# Altium schematic sheet Sheet1.SchDoc (part 1 of 3)
size 420 x 297 mm; SheetNumber: 1; SheetTotal: 2
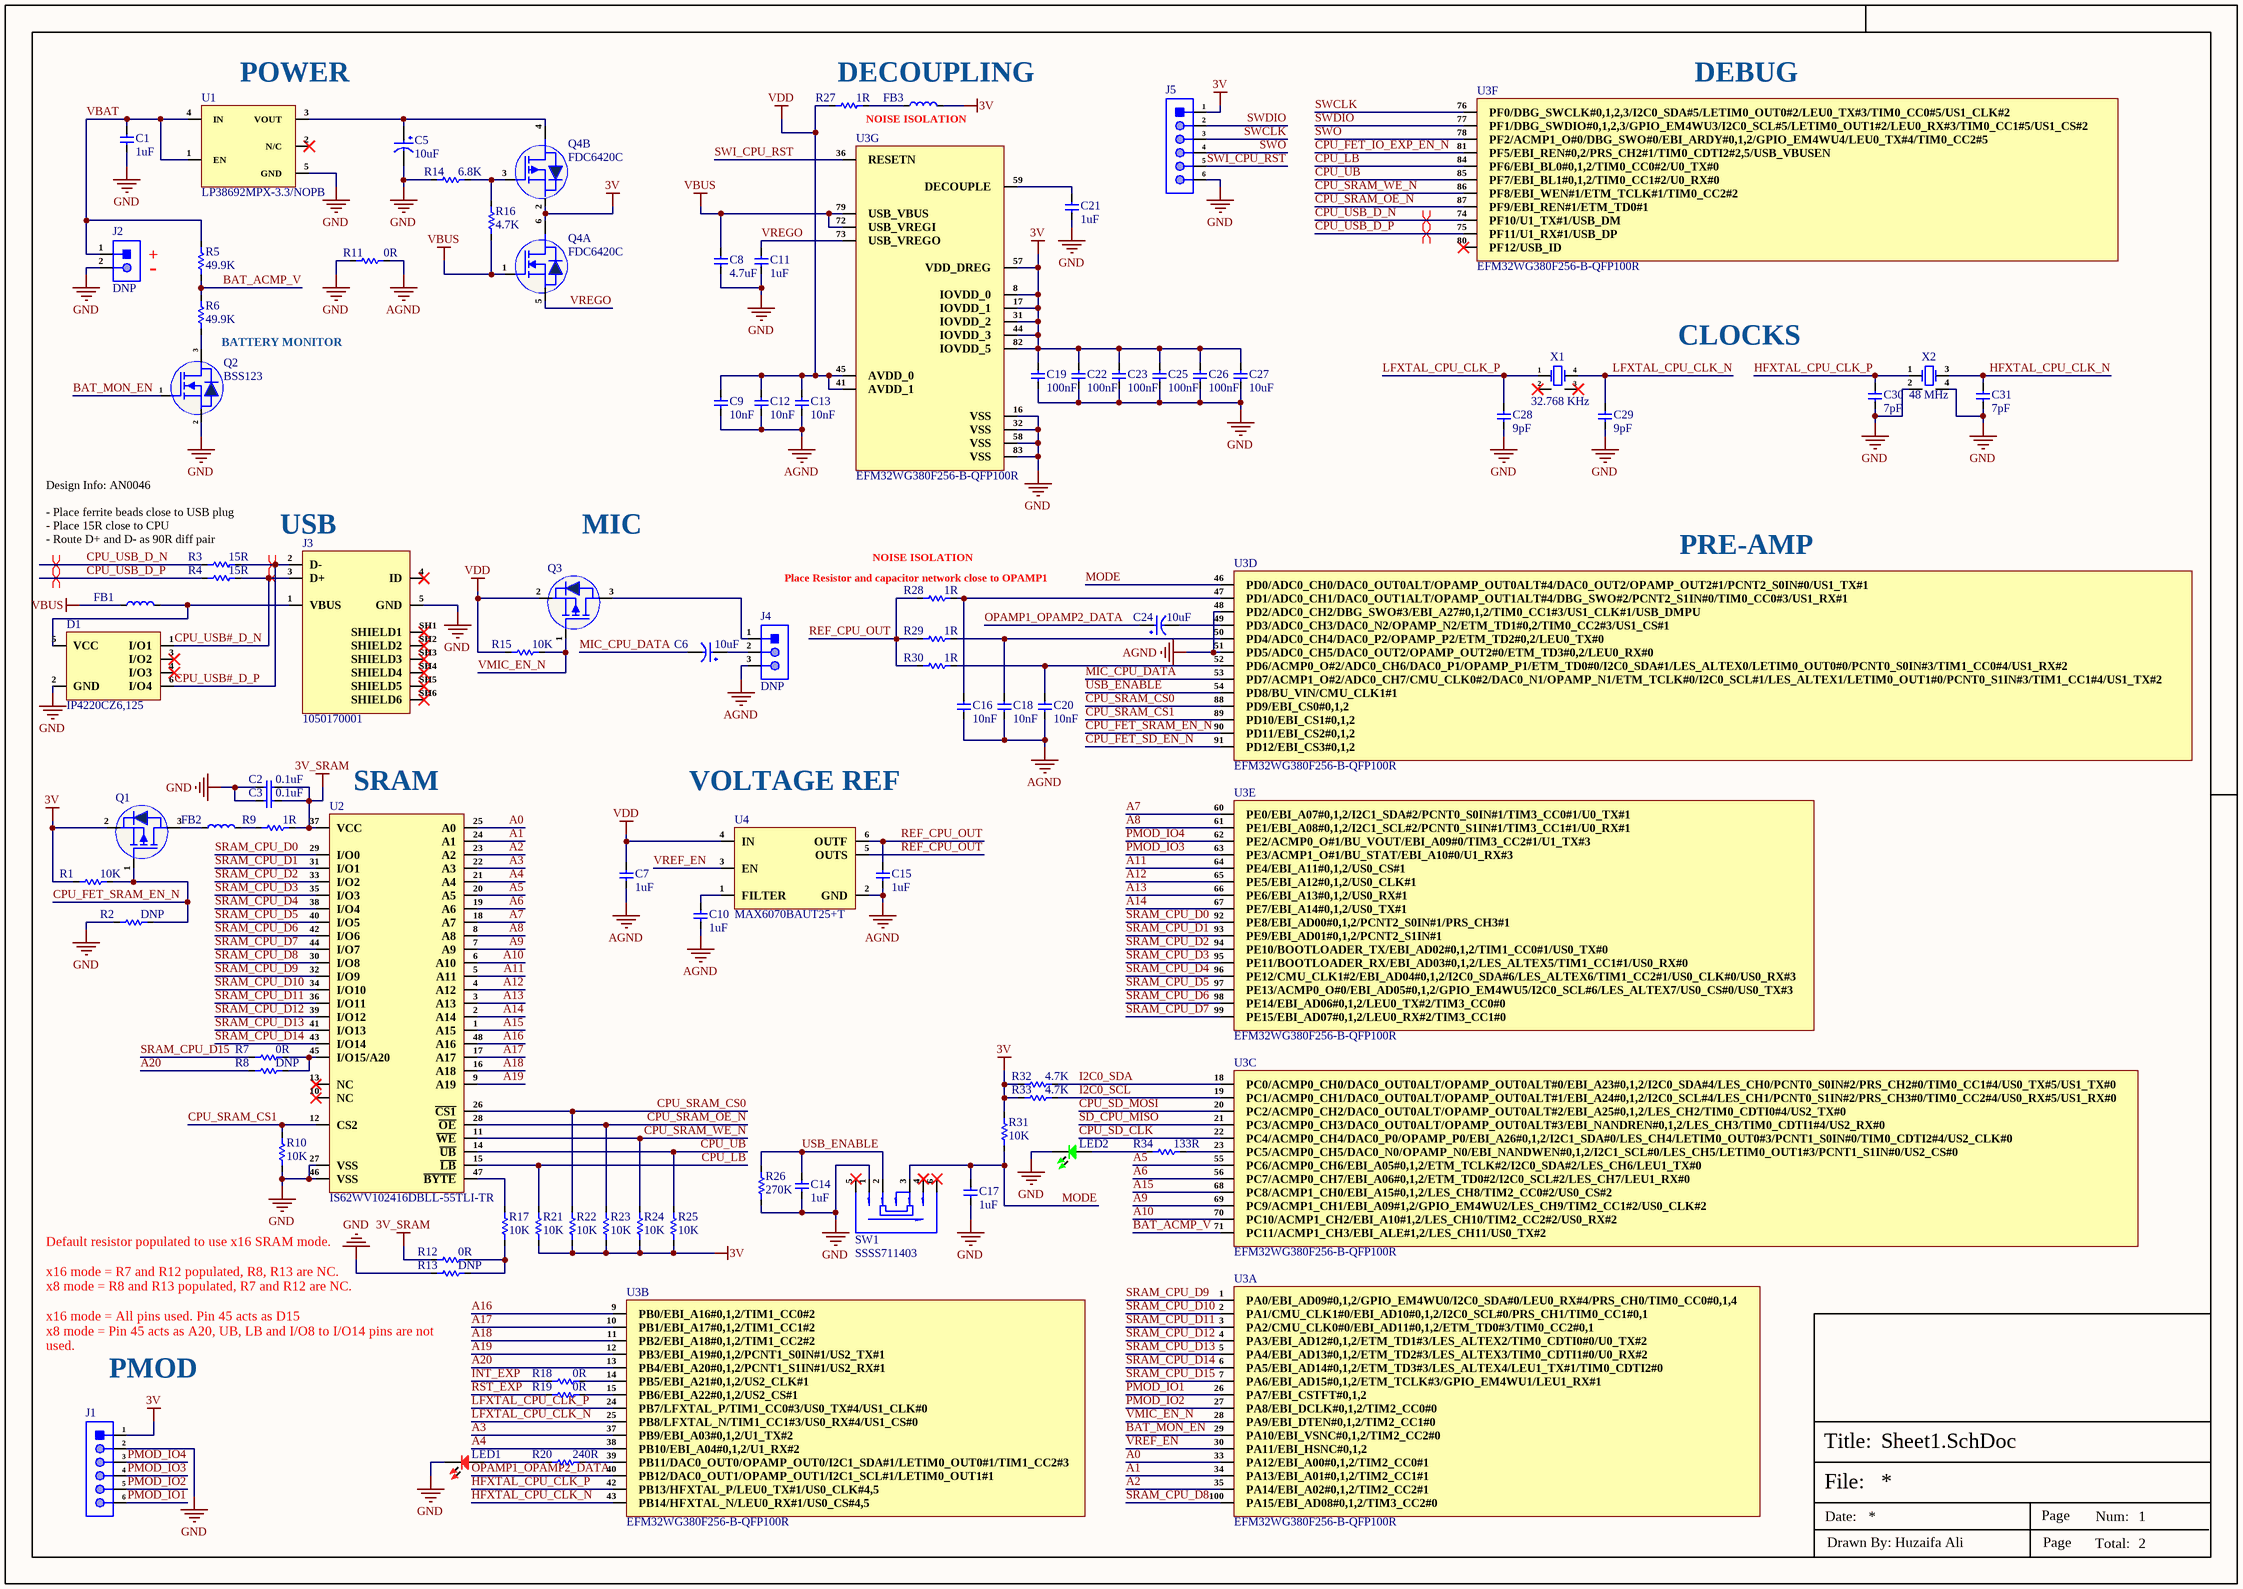
[diagram p0: Sheet1.SchDoc]

## Parts
C1  1uF  [Cap-0402]
C2  0.1uF  [Cap-0402]
C3  0.1uF  [Cap-0402]
C5  10uF  [Case-A]
C6  10uF  [Case-A]
C7  1uF  [Cap-0402]
C8  4.7uF  [Cap-0402]
C9  10nF  [Cap-0402]
C10  1uF  [Cap-0402]
C11  1uF  [Cap-0402]
C12  10nF  [Cap-0402]
C13  10nF  [Cap-0402]
C14  1uF  [Cap-0402]
C15  1uF  [Cap-0402]
C16  10nF  [Cap-0402]
C17  1uF  [Cap-0402]
C18  10nF  [Cap-0402]
C19  100nF  [cap-0402]
C20  10nF  [Cap-0402]
C21  1uF  [Cap-0402]
C22  100nF  [cap-0402]
C23  100nF  [cap-0402]
C24  10uF  [Case-A]
C25  100nF  [cap-0402]
C26  100nF  [cap-0402]
C27  10uF  [Cap-0603]
C28  9pF  [Cap-0402]
C29  9pF  [Cap-0402]
C30  7pF  [Cap-0402]
C31  7pF  [Cap-0402]
D1  IP4220CZ6,125  [6-TSOP]
FB1  BLM21PG221SN1D  [Ind-0805]  (value not drawn)
FB2  BLM18HG601SN1D  [IND-0603 (1608 Metric)]  (value not drawn)
FB3  CBW201209U102T  [Ind-0805]  (value not drawn)
J1  MA06-1SMD_BOARD_EDGE  [TSM-106-X-SH-BOARDEDGE]  (value not drawn)  (no BOM)
J2  DNP  [HDR1X2_]
J3  1050170001  [1050170001]
J4  DNP  [HDR1X3_]
J5  MA06-1SMD_BOARD_EDGE  [TSM-106-X-SH-BOARDEDGE]  (value not drawn)  (no BOM)
LED1  RED  [LED-0603]  (value not drawn)
LED2  Emerald  [LED-0603]  (value not drawn)
Q1  LBSS84WT1G  [SC-70]  (value not drawn)
Q2  BSS123  [SOT-23]
Q3  LBSS84WT1G  [SC-70]  (value not drawn)
Q4  FDC6420C  [SuperSOT-6]  (parts A,B of 2)
R1  10K  [Res-0402]
R2  DNP  [Res-0402]
R3  15R  [Res-0603]
R4  15R  [Res-0603]
R5  49.9K  [Res-0402]
R6  49.9K  [Res-0402]
R7  0R  [Res-0402]
R8  DNP  [Res-0402]
R9  1R  [Res-0402]
R10  10K  [Res-0402]
R11  0R  [Res-0603]
R12  0R  [Res-0402]
R13  DNP  [Res-0402]
R14  6.8K  [Res-0402]
R15  10K  [Res-0402]
R16  4.7K  [Res-0402]
R17  10K  [Res-0402]
R18  0R  [Res-0402]
R19  0R  [Res-0402]
R20  240R  [Res-0402]
R21  10K  [Res-0402]
R22  10K  [Res-0402]
R23  10K  [Res-0402]
R24  10K  [Res-0402]
R25  10K  [Res-0402]
R26  270K  [Res-0603]
R27  1R  [Res-0402]
R28  1R  [Res-0402]
R29  1R  [Res-0402]
R30  1R  [Res-0402]
R31  10K  [Res-0402]
R32  4.7K  [Res-0402]
R33  4.7K  [Res-0402]
R34  133R  [Res-0402]
SW1  SSSS711403  [SSSS711403]
U1  LP38692MPX-3.3/NOPB  [SOT-223-5]
U2  IS62WV102416DBLL-55TLI-TR  [48-TSOP I]
U3  EFM32WG380F256-B-QFP100R  [LQFP-100]  (parts A,B,C,D,E,F,G of 7)
U4  MAX6070BAUT25+T  [SOT-23-6]
X1  32.768 KHz  [MC-146_]
X2  48 MHz  [SMD2016-4P]

## Nets
3V: C19.2 C22.2 C23.2 C25.2 C26.2 C27.2 FB3.2 J1.1 J5.1 Q1.2(S) Q4.2(S2) Q4.6(D1) R1.1 R21.1 R22.1 R23.1 R24.1 R25.1 R31.2 R32.1 R33.1 U3.8(IOVDD_0) U3.17(IOVDD_1) U3.31(IOVDD_2) U3.44(IOVDD_3) U3.57(VDD_DREG) U3.82(IOVDD_5)
3V_SRAM: C2.1 C3.1 R9.1 R12.1 U2.37(VCC)
AGND: C7.1 C9.1 C10.1 C12.1 C13.1 C15.1 C16.1 C18.1 C20.1 J4.3 R11.2 U3.48(PD2/ADC0_CH2/DBG_SWO#3/EBI_A27#0,1,2/TIM0_CC1#3/US1_CLK#1/USB_DMPU) U3.51(PD5/ADC0_CH5/DAC0_OUT2/OPAMP_OUT2#0/ETM_TD3#0,2/LEU0_RX#0) U4.2(GND)
GND: C1.1 C2.2 C3.2 C5.2 C8.1 C11.1 C14.1 C17.1 C19.1 C21.1 C22.1 C23.1 C25.1 C26.1 C27.1 C28.1 C29.1 C30.1 C31.1 D1.2(GND) J1.2 J2.2 J3.5(GND) J5.6 LED1.2 LED2.2 Q2.2(S) R2.1 R10.1 R11.1 R13.1 R14.1 R26.1 SW1.1 U1.5(GND) U2.27(VSS) U2.46(VSS) U3.16(VSS) U3.32(VSS) U3.58(VSS) U3.83(VSS) X2.2(GND) X2.4(GND)
VBUS: C8.2 FB1.1 Q4.1(G1) R16.1 U3.72(USB_VREGI) U3.79(USB_VBUS)
VDD: C7.2 C9.2 C12.2 C13.2 Q3.2(S) R15.1 R27.2 U3.41(AVDD_1) U3.45(AVDD_0) U4.4(IN)
A0: U2.25(A0) U3.33(PA12/EBI_A00#0,1,2/TIM2_CC0#1)
A1: U2.24(A1) U3.34(PA13/EBI_A01#0,1,2/TIM2_CC1#1)
A2: U2.23(A2) U3.35(PA14/EBI_A02#0,1,2/TIM2_CC2#1)
A3: U2.22(A3) U3.37(PB9/EBI_A03#0,1,2/U1_TX#2)
A4: U2.21(A4) U3.38(PB10/EBI_A04#0,1,2/U1_RX#2)
A5: U2.20(A5) U3.55(PC6/ACMP0_CH6/EBI_A05#0,1,2/ETM_TCLK#2/I2C0_SDA#2/LES_CH6/LEU1_TX#0)
A6: U2.19(A6) U3.56(PC7/ACMP0_CH7/EBI_A06#0,1,2/ETM_TD0#2/I2C0_SCL#2/LES_CH7/LEU1_RX#0)
A7: U2.18(A7) U3.60(PE0/EBI_A07#0,1,2/I2C1_SDA#2/PCNT0_S0IN#1/TIM3_CC0#1/U0_TX#1)
A8: U2.8(A8) U3.61(PE1/EBI_A08#0,1,2/I2C1_SCL#2/PCNT0_S1IN#1/TIM3_CC1#1/U0_RX#1)
A9: U2.7(A9) U3.69(PC9/ACMP1_CH1/EBI_A09#1,2/GPIO_EM4WU2/LES_CH9/TIM2_CC1#2/US0_CLK#2)
A10: U2.6(A10) U3.70(PC10/ACMP1_CH2/EBI_A10#1,2/LES_CH10/TIM2_CC2#2/US0_RX#2)
A11: U2.5(A11) U3.64(PE4/EBI_A11#0,1,2/US0_CS#1)
A12: U2.4(A12) U3.65(PE5/EBI_A12#0,1,2/US0_CLK#1)
A13: U2.3(A13) U3.66(PE6/EBI_A13#0,1,2/US0_RX#1)
A14: U2.2(A14) U3.67(PE7/EBI_A14#0,1,2/US0_TX#1)
A15: U2.1(A15) U3.68(PC8/ACMP1_CH0/EBI_A15#0,1,2/LES_CH8/TIM2_CC0#2/US0_CS#2)
A16: U2.48(A16) U3.9(PB0/EBI_A16#0,1,2/TIM1_CC0#2)
A17: U2.17(A17) U3.10(PB1/EBI_A17#0,1,2/TIM1_CC1#2)
A18: U2.16(A18) U3.11(PB2/EBI_A18#0,1,2/TIM1_CC2#2)
A19: U2.9(A19) U3.12(PB3/EBI_A19#0,1,2/PCNT1_S0IN#1/US2_TX#1)
A20: R8.1 U3.13(PB4/EBI_A20#0,1,2/PCNT1_S1IN#1/US2_RX#1)
BAT_ACMP_V: R5.1 R6.2 U3.71(PC11/ACMP1_CH3/EBI_ALE#1,2/LES_CH11/US0_TX#2)
BAT_MON_EN: Q2.1(G) U3.29(PA10/EBI_VSNC#0,1,2/TIM2_CC2#0)
CPU_FET_IO_EXP_EN_N: U3.81(PF5/EBI_REN#0,2/PRS_CH2#1/TIM0_CDTI2#2,5/USB_VBUSEN)
CPU_FET_SD_EN_N: U3.91(PD12/EBI_CS3#0,1,2)
CPU_FET_SRAM_EN_N: Q1.1(G) R1.2 R2.2 U3.90(PD11/EBI_CS2#0,1,2)
CPU_LB: R21.2 U2.15(~{LB}) U3.84(PF6/EBI_BL0#0,1,2/TIM0_CC0#2/U0_TX#0)
CPU_SD_CLK: U3.22(PC4/ACMP0_CH4/DAC0_P0/OPAMP_P0/EBI_A26#0,1,2/I2C1_SDA#0/LES_CH4/LETIM0_OUT0#3/PCNT1_S0IN#0/TIM0_CDTI2#4/US2_CLK#0)
CPU_SD_MOSI: U3.20(PC2/ACMP0_CH2/DAC0_OUT0ALT/OPAMP_OUT0ALT#2/EBI_A25#0,1,2/LES_CH2/TIM0_CDTI0#4/US2_TX#0)
CPU_SRAM_CS0: R22.2 U2.26(~{CS1}) U3.88(PD9/EBI_CS0#0,1,2)
CPU_SRAM_CS1: R10.2 U2.12(CS2) U3.89(PD10/EBI_CS1#0,1,2)
CPU_SRAM_OE_N: R23.2 U2.28(~{OE}) U3.87(PF9/EBI_REN#1/ETM_TD0#1)
CPU_SRAM_WE_N: R24.2 U2.11(~{WE}) U3.86(PF8/EBI_WEN#1/ETM_TCLK#1/TIM0_CC2#2)
CPU_UB: R25.2 U2.14(~{UB}) U3.85(PF7/EBI_BL1#0,1,2/TIM0_CC1#2/U0_RX#0)
CPU_USB#_D_N: D1.1(I/O1) J3.3(D+) R4.2
CPU_USB#_D_P: D1.6(I/O4) J3.2(D-) R3.2
CPU_USB_D_N: R3.1 U3.74(PF10/U1_TX#1/USB_DM)
CPU_USB_D_P: R4.1 U3.75(PF11/U1_RX#1/USB_DP)
HFXTAL_CPU_CLK_N: C31.2 U3.43(PB14/HFXTAL_N/LEU0_RX#1/US0_CS#4,5) X2.3(OSC2)
HFXTAL_CPU_CLK_P: C30.2 U3.42(PB13/HFXTAL_P/LEU0_TX#1/US0_CLK#4,5) X2.1(OSC1)
I2C0_SCL: R33.2 U3.19(PC1/ACMP0_CH1/DAC0_OUT0ALT/OPAMP_OUT0ALT#1/EBI_A24#0,1,2/I2C0_SCL#4/LES_CH1/PCNT0_S1IN#2/PRS_CH3#0/TIM0_CC2#4/US0_RX#5/US1_RX#0)
I2C0_SDA: R32.2 U3.18(PC0/ACMP0_CH0/DAC0_OUT0ALT/OPAMP_OUT0ALT#0/EBI_A23#0,1,2/I2C0_SDA#4/LES_CH0/PCNT0_S0IN#2/PRS_CH2#0/TIM0_CC1#4/US0_TX#5/US1_TX#0)
INT_EXP: R18.1
LFXTAL_CPU_CLK_N: C29.2 U3.25(PB8/LFXTAL_N/TIM1_CC1#3/US0_RX#4/US1_CS#0) X1.4(OSC2)
LFXTAL_CPU_CLK_P: C28.2 U3.24(PB7/LFXTAL_P/TIM1_CC0#3/US0_TX#4/US1_CLK#0) X1.1(OSC1)
MIC_CPU_DATA: C6.2 U3.53(PD7/ACMP1_O#2/ADC0_CH7/CMU_CLK0#2/DAC0_N1/OPAMP_N1/ETM_TCLK#0/I2C0_SCL#1/LES_ALTEX1/LETIM0_OUT1#0/PCNT0_S1IN#3/TIM1_CC1#4/US1_TX#2)
MODE: C17.2 R31.1 SW1.3 U3.46(PD0/ADC0_CH0/DAC0_OUT0ALT/OPAMP_OUT0ALT#4/DAC0_OUT2/OPAMP_OUT2#1/PCNT2_S0IN#0/US1_TX#1)
OPAMP1_OPAMP2_DATA: C24.1 U3.40(PB12/DAC0_OUT1/OPAMP_OUT1/I2C1_SCL#1/LETIM0_OUT1#1)
PMOD_IO1: J1.6 U3.26(PA7/EBI_CSTFT#0,1,2)
PMOD_IO2: J1.5 U3.27(PA8/EBI_DCLK#0,1,2/TIM2_CC0#0)
PMOD_IO3: J1.4 U3.63(PE3/ACMP1_O#1/BU_STAT/EBI_A10#0/U1_RX#3)
PMOD_IO4: J1.3 U3.62(PE2/ACMP0_O#1/BU_VOUT/EBI_A09#0/TIM3_CC2#1/U1_TX#3)
REF_CPU_OUT: C15.2 R28.2 R29.2 R30.2 U4.5(OUTS) U4.6(OUTF)
RST_EXP: R19.1
SD_CPU_MISO: U3.21(PC3/ACMP0_CH3/DAC0_OUT0ALT/OPAMP_OUT0ALT#3/EBI_NANDREN#0,1,2/LES_CH3/TIM0_CDTI1#4/US2_RX#0)
SRAM_CPU_D0: U2.29(I/O0) U3.92(PE8/EBI_AD00#0,1,2/PCNT2_S0IN#1/PRS_CH3#1)
SRAM_CPU_D1: U2.31(I/O1) U3.93(PE9/EBI_AD01#0,1,2/PCNT2_S1IN#1)
SRAM_CPU_D2: U2.33(I/O2) U3.94(PE10/BOOTLOADER_TX/EBI_AD02#0,1,2/TIM1_CC0#1/US0_TX#0)
SRAM_CPU_D3: U2.35(I/O3) U3.95(PE11/BOOTLOADER_RX/EBI_AD03#0,1,2/LES_ALTEX5/TIM1_CC1#1/US0_RX#0)
SRAM_CPU_D4: U2.38(I/O4) U3.96(PE12/CMU_CLK1#2/EBI_AD04#0,1,2/I2C0_SDA#6/LES_ALTEX6/TIM1_CC2#1/US0_CLK#0/US0_RX#3)
SRAM_CPU_D5: U2.40(I/O5) U3.97(PE13/ACMP0_O#0/EBI_AD05#0,1,2/GPIO_EM4WU5/I2C0_SCL#6/LES_ALTEX7/US0_CS#0/US0_TX#3)
SRAM_CPU_D6: U2.42(I/O6) U3.98(PE14/EBI_AD06#0,1,2/LEU0_TX#2/TIM3_CC0#0)
SRAM_CPU_D7: U2.44(I/O7) U3.99(PE15/EBI_AD07#0,1,2/LEU0_RX#2/TIM3_CC1#0)
SRAM_CPU_D8: U2.30(I/O8) U3.100(PA15/EBI_AD08#0,1,2/TIM3_CC2#0)
SRAM_CPU_D9: U2.32(I/O9) U3.1(PA0/EBI_AD09#0,1,2/GPIO_EM4WU0/I2C0_SDA#0/LEU0_RX#4/PRS_CH0/TIM0_CC0#0,1,4)
SRAM_CPU_D10: U2.34(I/O10) U3.2(PA1/CMU_CLK1#0/EBI_AD10#0,1,2/I2C0_SCL#0/PRS_CH1/TIM0_CC1#0,1)
SRAM_CPU_D11: U2.36(I/O11) U3.3(PA2/CMU_CLK0#0/EBI_AD11#0,1,2/ETM_TD0#3/TIM0_CC2#0,1)
SRAM_CPU_D12: U2.39(I/O12) U3.4(PA3/EBI_AD12#0,1,2/ETM_TD1#3/LES_ALTEX2/TIM0_CDTI0#0/U0_TX#2)
SRAM_CPU_D13: U2.41(I/O13) U3.5(PA4/EBI_AD13#0,1,2/ETM_TD2#3/LES_ALTEX3/TIM0_CDTI1#0/U0_RX#2)
SRAM_CPU_D14: U2.43(I/O14) U3.6(PA5/EBI_AD14#0,1,2/ETM_TD3#3/LES_ALTEX4/LEU1_TX#1/TIM0_CDTI2#0)
SRAM_CPU_D15: R7.1 U3.7(PA6/EBI_AD15#0,1,2/ETM_TCLK#3/GPIO_EM4WU1/LEU1_RX#1)
SWCLK: J5.3 U3.76(PF0/DBG_SWCLK#0,1,2,3/I2C0_SDA#5/LETIM0_OUT0#2/LEU0_TX#3/TIM0_CC0#5/US1_CLK#2)
SWDIO: J5.2 U3.77(PF1/DBG_SWDIO#0,1,2,3/GPIO_EM4WU3/I2C0_SCL#5/LETIM0_OUT1#2/LEU0_RX#3/TIM0_CC1#5/US1_CS#2)
SWI_CPU_RST: J5.5 U3.36(RESETN)
SWO: J5.4 U3.78(PF2/ACMP1_O#0/DBG_SWO#0/EBI_ARDY#0,1,2/GPIO_EM4WU4/LEU0_TX#4/TIM0_CC2#5)
USB_ENABLE: C14.2 R26.2 SW1.2 U3.54(PD8/BU_VIN/CMU_CLK1#1)
VBAT: C1.2 J2.1 R5.2 U1.1(EN) U1.4(IN)
VMIC_EN_N: Q3.1(G) R15.2 U3.28(PA9/EBI_DTEN#0,1,2/TIM2_CC1#0)
VREF_EN: U3.30(PA11/EBI_HSNC#0,1,2) U4.3(EN)
VREGO: C11.2 Q4.5(S1) U3.73(USB_VREGO)
NetC5_1: C5.1 Q4.4(D2) U1.3(VOUT)
NetC6_1: C6.1 J4.2
NetC10_2: C10.2 U4.1(FILTER)
NetC16_2: C16.2 R28.1 U3.47(PD1/ADC0_CH1/DAC0_OUT1ALT/OPAMP_OUT1ALT#4/DBG_SWO#2/PCNT2_S1IN#0/TIM0_CC0#3/US1_RX#1)
NetC18_2: C18.2 R29.1 U3.50(PD4/ADC0_CH4/DAC0_P2/OPAMP_P2/ETM_TD2#0,2/LEU0_TX#0)
NetC20_2: C20.2 R30.1 U3.52(PD6/ACMP0_O#2/ADC0_CH6/DAC0_P1/OPAMP_P1/ETM_TD0#0/I2C0_SDA#1/LES_ALTEX0/LETIM0_OUT0#0/PCNT0_S0IN#3/TIM1_CC0#4/US1_RX#2)
NetC21_2: C21.2 U3.59(DECOUPLE)
NetC24_2: C24.2 U3.49(PD3/ADC0_CH3/DAC0_N2/OPAMP_N2/ETM_TD1#0,2/TIM0_CC2#3/US1_CS#1)
NetD1_5: D1.5(VCC) FB1.2 J3.1(VBUS)
NetFB2_1: FB2.1 Q1.3(D)
NetFB2_2: FB2.2 R9.2
NetFB3_1: FB3.1 R27.1
NetJ4_1: J4.1 Q3.3(D)
NetLED1_1: LED1.1 R20.1
NetLED2_1: LED2.1 R34.1
NetQ2_3: Q2.3(D) R6.1
NetQ4_3: Q4.3(G2) R14.2 R16.2
NetR7_2: R7.2 R8.2 U2.45(I/O15/A20)
NetR12_2: R12.2 R13.2 R17.1
NetR17_2: R17.2 U2.47(~{BYTE})
NetR18_2: R18.2 U3.14(PB5/EBI_A21#0,1,2/US2_CLK#1)
NetR19_2: R19.2 U3.15(PB6/EBI_A22#0,1,2/US2_CS#1)
NetR20_2: R20.2 U3.39(PB11/DAC0_OUT0/OPAMP_OUT0/I2C1_SDA#1/LETIM0_OUT0#1/TIM1_CC2#3)
NetR34_2: R34.2 U3.23(PC5/ACMP0_CH5/DAC0_N0/OPAMP_N0/EBI_NANDWEN#0,1,2/I2C1_SCL#0/LES_CH5/LETIM0_OUT1#3/PCNT1_S1IN#0/US2_CS#0)

Not connected (* = marked no-connect by the designer): D1 3(I/O2)* 4(I/O3)*; J3 4(ID)* SH1(SHIELD1)* SH2(SHIELD2)* SH3(SHIELD3)* SH4(SHIELD4)* SH5(SHIELD5)* SH6(SHIELD6)*; SW1 4* 5* 6*; U1 2(N/C)*; U2 10(NC)* 13(NC)*; U3 80(PF12/USB_ID)*; X1 2(GND)* 3(GND)*

## Layout directives
differential pair; net class USB_PROGRAM; differential pair class USB_PROGRAM_LINES; rule Impedance Constraint [Min = 85.00    Max = 90.00    ]; rule Matched Net Lengths [Tolerance = 50mil]: CPU_USB#_D_N, CPU_USB#_D_P, CPU_USB_D_N, CPU_USB_D_P

## Notes on the sheet
- (near U1) POWER
- NOISE ISOLATION
- DECOUPLING
- DEBUG
- +
- -
- BATTERY MONITOR
- CLOCKS
- (near J3) USB
- MIC
- Design Info: AN0046
  - Place ferrite beads close to USB plug
  - Place 15R close to CPU
  - Route D+ and D- as 90R diff pair
- (near R28) Place Resistor and capacitor network close to OPAMP1
- (near R28) NOISE ISOLATION
- PRE-AMP
- (near U2) SRAM
- (near U4) VOLTAGE REF
- Default resistor populated to use x16 SRAM mode.
  x16 mode = R7 and R12 populated, R8, R13 are NC.
  x8 mode = R8 and R13 populated, R7 and R12 are NC.
  x16 mode = All pins used. Pin 45 acts as D15
  x8 mode = Pin 45 acts as A20, UB, LB and I/O8 to I/O14 pins are not used.
- (near J1) PMOD
- File:
- Title:
- Date:
- Page
- Num:
- Total:
- Drawn By: Huzaifa Ali